# Altium schematic sheet CONNECTOR.SchDoc
size A4; SheetNumber: 6; SheetTotal: 8
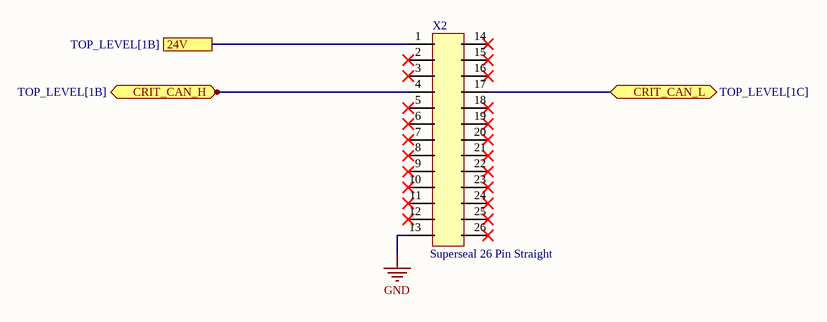
[diagram p0: CONNECTOR.SchDoc]

## Parts
X2  Superseal 26 Pin Straight  [SUPERSEAL-26Pin-STR]

## Ports
24V (see TOP_LEVEL[1B]), CRIT_CAN_H (bidir, see TOP_LEVEL[1B]), CRIT_CAN_L (bidir, see TOP_LEVEL[1C])

## Nets
GND: X2.13
24V: X2.1 ; port 24V
CRIT_CAN_H: X2.4 ; port CRIT_CAN_H
CRIT_CAN_L: X2.17 ; port CRIT_CAN_L

Not connected (* = marked no-connect by the designer): X2 2* 3* 5* 6* 7* 8* 9* 10* 11* 12* 14* 15* 16* 18* 19* 20* 21* 22* 23* 24* 25* 26*

## Library data of the parts
X2 = 6437288-6: Connector Header Through Hole 26 position 0.118" (3.00mm)